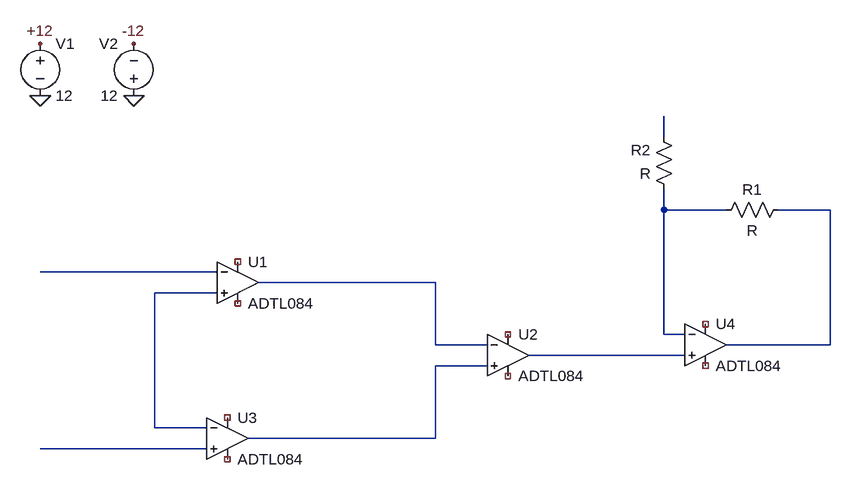
[diagram p0: schematic tp3_borrador_viejo.asc]
tp3_borrador_viejo.asc, the LTspice schematic file:
Version 4.1
SHEET 1 1060 680
WIRE 800 -96 800 -128
WIRE 800 16 800 -16
WIRE 896 16 800 16
WIRE 1056 16 976 16
WIRE 112 112 -160 112
WIRE 448 128 176 128
WIRE 112 144 16 144
WIRE 800 208 800 16
WIRE 832 208 800 208
WIRE 448 224 448 128
WIRE 528 224 448 224
WIRE 1056 224 1056 16
WIRE 1056 224 896 224
WIRE 832 240 592 240
WIRE 528 256 448 256
WIRE 16 352 16 144
WIRE 96 352 16 352
WIRE 448 368 448 256
WIRE 448 368 160 368
WIRE 96 384 -160 384
FLAG -160 -160 0
FLAG -16 -160 0
FLAG -160 -240 +12
FLAG -16 -240 -12
SYMBOL OpAmps\\ADTL084 144 64 R0
SYMATTR InstName U1
SYMBOL OpAmps\\ADTL084 560 176 R0
SYMATTR InstName U2
SYMBOL OpAmps\\ADTL084 128 304 R0
SYMATTR InstName U3
SYMBOL OpAmps\\ADTL084 864 160 R0
SYMATTR InstName U4
SYMBOL voltage -160 -256 R0
WINDOW 123 0 0 Left 0
WINDOW 39 0 0 Left 0
SYMATTR InstName V1
SYMATTR Value 12
SYMBOL voltage -16 -144 R180
WINDOW 0 24 96 Left 2
WINDOW 3 24 16 Left 2
WINDOW 123 0 0 Left 0
WINDOW 39 0 0 Left 0
SYMATTR InstName V2
SYMATTR Value 12
SYMBOL res 992 0 R90
WINDOW 0 0 56 VBottom 2
WINDOW 3 32 56 VTop 2
SYMATTR InstName R1
SYMBOL res 816 0 R180
WINDOW 0 36 76 Left 2
WINDOW 3 36 40 Left 2
SYMATTR InstName R2

The netlist it stands for:
* tp3_borrador_viejo.asc
X§U1 N006 N004 NC_01 NC_02 N005 ADTL084  ; pins In+ In- V+ V- OUT
X§U2 N008 N005 NC_03 NC_04 N007 ADTL084  ; pins In+ In- V+ V- OUT
X§U3 N009 N006 NC_05 NC_06 N008 ADTL084  ; pins In+ In- V+ V- OUT
X§U4 N007 N002 NC_07 NC_08 N003 ADTL084  ; pins In+ In- V+ V- OUT
V1 +12 0 12
V2 0 -12 12
R1 N003 N002 R
R2 N002 N001 R
.lib ADTL084.lib
.backanno
.end